# Altium project John Wollam.PrjPCB (part 2 of 2)

## Sheet Connector_Section.SchDoc
size A4; DocumentNumber: 5; SheetNumber: 5; SheetTotal: 5
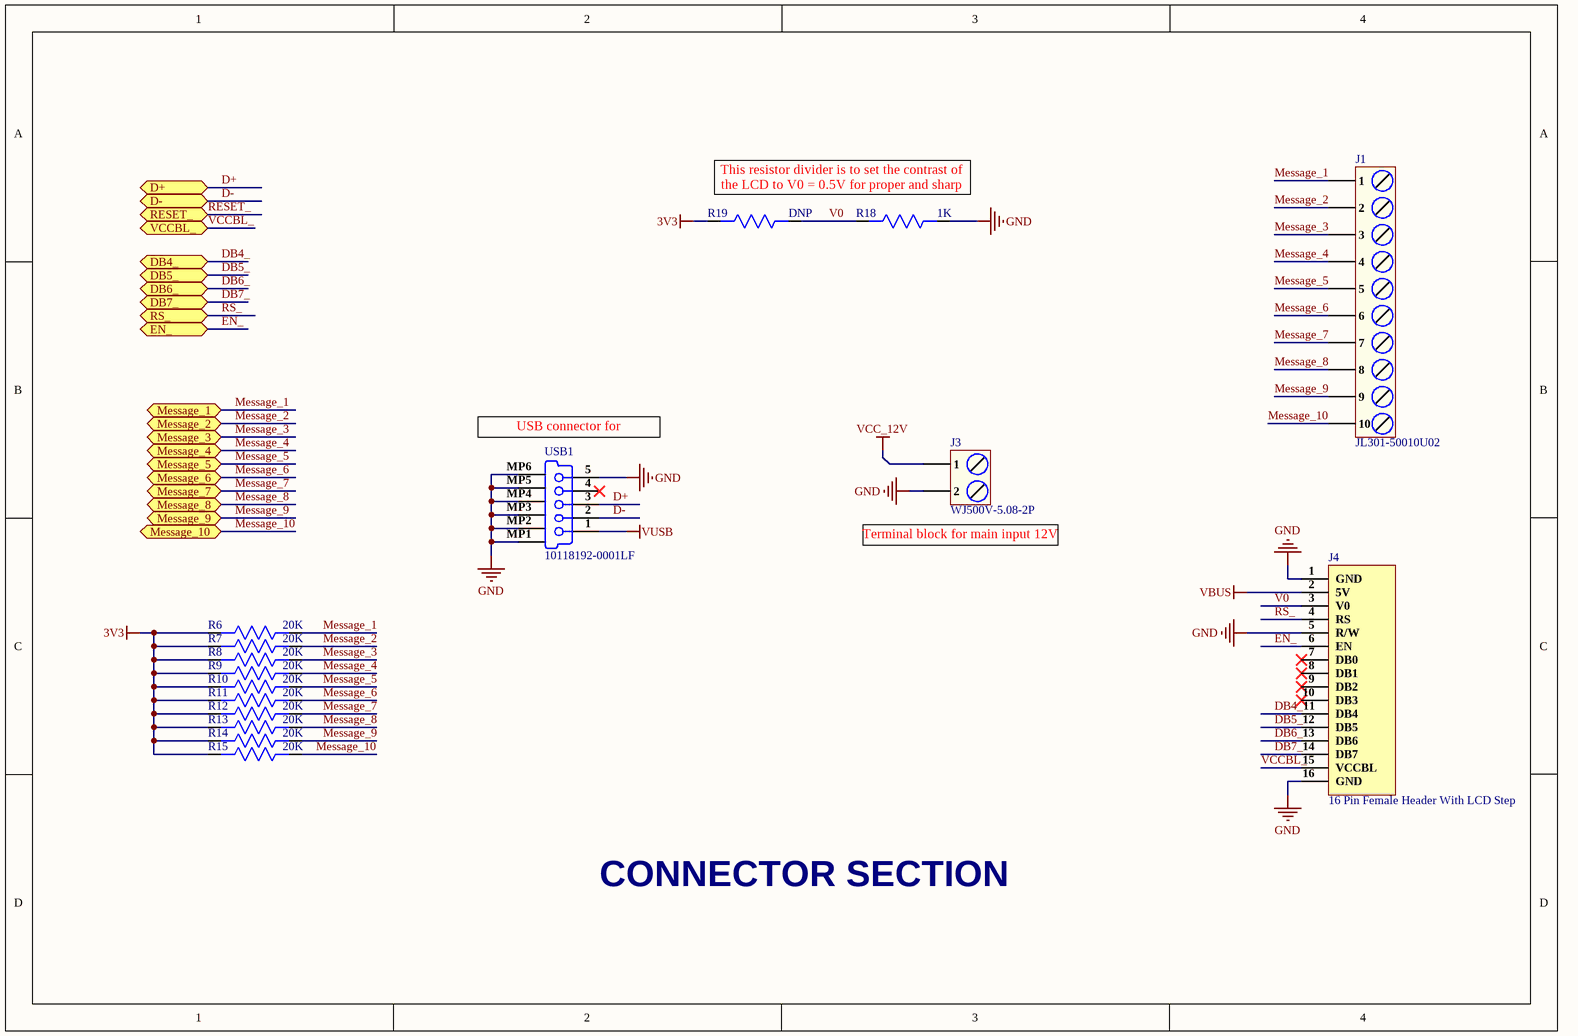
[diagram p3: Connector_Section.SchDoc]

### Parts
J1  JL301-50010U02  [JL301-50010U02]
J3  WJ500V-5.08-2P  [Terminal Block 2P_]
J4  16 Pin Female Header With LCD Step  [PPPC161LFBN-RC_]
R6  20K  [Res-0603]
R7  20K  [Res-0603]
R8  20K  [Res-0603]
R9  20K  [Res-0603]
R10  20K  [Res-0603]
R11  20K  [Res-0603]
R12  20K  [Res-0603]
R13  20K  [Res-0603]
R14  20K  [Res-0603]
R15  20K  [Res-0603]
R18  1K  [Res-0603]
R19  DNP  [Res-0603]
USB1  10118192-0001LF  [10118192-0001LF_]

### Ports
D+ (bidir), D- (bidir), DB4_ (bidir), DB5_ (bidir), DB6_ (bidir), DB7_ (bidir), EN_ (bidir), Message_1 (bidir), Message_2 (bidir), Message_3 (bidir), Message_4 (bidir), Message_5 (bidir), Message_6 (bidir), Message_7 (bidir), Message_8 (bidir), Message_9 (bidir), Message_10 (bidir), RESET_ (bidir), RS_ (bidir), VCCBL_ (bidir)

### Nets
3V3: R6.2 R7.2 R8.2 R9.2 R10.2 R11.2 R12.2 R13.2 R14.2 R15.2 R19.2
GND: J3.2 J4.1(GND) J4.5(R/W) J4.16(GND) R18.1 USB1.5(GND) USB1.MP1 USB1.MP2 USB1.MP3 USB1.MP4 USB1.MP5 USB1.MP6
VBUS: J4.2(5V)
VCC_12V: J3.1
VUSB: USB1.1(V_BUS_(5V))
D+: USB1.3(D+) ; port D+
D-: USB1.2(D-) ; port D-
DB4_: J4.11(DB4) ; port DB4_
DB5_: J4.12(DB5) ; port DB5_
DB6_: J4.13(DB6) ; port DB6_
DB7_: J4.14(DB7) ; port DB7_
EN_: J4.6(EN) ; port EN_
Message_1: J1.1 R6.1 ; port Message_1
Message_2: J1.2 R7.1 ; port Message_2
Message_3: J1.3 R8.1 ; port Message_3
Message_4: J1.4 R9.1 ; port Message_4
Message_5: J1.5 R10.1 ; port Message_5
Message_6: J1.6 R11.1 ; port Message_6
Message_7: J1.7 R12.1 ; port Message_7
Message_8: J1.8 R13.1 ; port Message_8
Message_9: J1.9 R14.1 ; port Message_9
Message_10: J1.10 R15.1 ; port Message_10
RS_: J4.4(RS) ; port RS_
V0: J4.3(V0) R18.2 R19.1
VCCBL_: J4.15(VCCBL) ; port VCCBL_

Not connected (* = marked no-connect by the designer): J4 7(DB0)* 8(DB1)* 9(DB2)* 10(DB3)*; USB1 4(NC)*

### Notes on the sheet
- This resistor divider is to set the contrast of the LCD to V0 = 0.5V for proper and sharp display
- (near USB1) USB connector for programming
- (near J3) Terminal block for main input 12V
- CONNECTOR SECTION

### Library data of the parts
J1 = Terminal Block 10 Position (5MM): 15A 300V Blue Straight pin 5mm 10 Straight,P=5mm Screw terminal; Manufacturer: JILN; Manufacturer Part Number: JL301-50010U02; LCSC Part Number: C409141; ComponentLink1Description: LCSC; ComponentLink1URL: https://www.lcsc.com/product-detail/span-style-background-color-ff0-Screw-span-span-style-background-color-ff0-terminal-span_JILN-JL301-50010U02_C409141.html
J3 = Terminal Block 2POS: 2.5 18A Green Straight pin 5.08mm 1 14~30 2 Straight,P=5.08mm; Manufacturer: Ningbo Kangnex Elec; Manufacturer Part Number: WJ500V-5.08-2P; LCSC Part Number: C8465; ComponentLink1Description: LCSC; ComponentLink1URL: https://www.lcsc.com/product-detail/Screw-span-style-background-color-ff0-terminal-span_Ningbo-Kangnex-Elec-WJ500V-5-08-2P_C8465.html
J4 = PPPC161LFBN-RC: CONN HDR 16POS 0.1 GOLD PCB; Manufacturer: Sullins; Number of Positions: 16; Connector Type: Header,Socket; Pitch: 0.1inch; Supplier 1: Digi-Key; Manufacturer Part Number: PPPC161LFBN-RC; Stock 1: 6865; Pricing 1: 1=1.02, 10=0.897, 100=0.7742, 500=0.63342, 1000=0.56304, 5000=0.5083 (USD); Mount: Through Hole; Color: Black; Contact Plating: Gold; Contact Material: Bronze; Housing Material: Plastic; Package Quantity: 1000; Number of Rows: 1; Packaging: Bulk; Termination: Solder; Length: 41.1mm; Height: 8.5mm; Width: 2.5mm; Lead Free: Lead Free; Supplier Part Number 1: S7049-ND; LCSC Part Number: C3322257; ComponentLink1Description: LCSC; ComponentLink1URL: https://www.lcsc.com/product-detail/Female-Headers_Sullins-Connector-Solutions-PPPC161LFBN-RC_C3322257.html
R6-R15 = RC0603FR-0720KL: RES 20K OHM 1% 1/10W 0603; Manufacturer: Yageo; Resistance: 20kR; Temperature Coefficient: 100ppm/°C; Voltage Rating (DC): 50V; Power Rating: 100mW; Supplier 1: Arrow Electronics; Manufacturer Part Number: RC0603FR-0720KL; RoHS: Yes; Category: Chip SMD Resistors; Stock 1: 945000; Pricing 1: 5000=0.00240, 10000=0.00220, 25000=0.00200, 50000=0.00190, 125000=0.00180 (USD); Case/Package: 0603; Number of Pins: 2; Case Code (Imperial): 0603; Case Code (Metric): 1608; Size Code: 0603; Min Operating Temperature: -55°C; Max Operating Temperature: 155°C; Tolerance: 1%; Packaging: Tape and Reel; Resistor Type: Thick Film; Voltage Rating: 50V; Package Quantity: 1; Termination: SMD/SMT; Number of Terminations: 2; Max Power Dissipation: 100mW; Features: Moisture Resistant; Series: RC; Technology: THICK FILM; Construction: Rectangular; Resistance Tolerance: 1%; Length: 0.063inch; Width: 0.031inch; Height: 0.022inch; Depth: 0.8mm; Lead Free: Lead Free; RoHS Compliant: Yes; REACH SVHC: No SVHC; Military Standard: Not; ComponentLink1URL: https://datasheet.ciiva.com/11808/0900766b80f96399-11808275.pdf?src-supplier=RSComponents; ComponentLink1Description: https://datasheet.ciiva.com/11808/0900766b80f96399-11808275.pdf?src-supplier=RSComponents; ComponentLink2URL: https://datasheet.ciiva.com/22747/443971-22747525.pdf?src-supplier=Element14; ComponentLink2Description: https://datasheet.ciiva.com/22747/443971-22747525.pdf?src-supplier=Element14; ComponentLink3URL: https://datasheet.ciiva.com/2453/pyu-r-int-thick-7-2453911.pdf?src-supplier=Digi-Key; ComponentLink3Description: https://datasheet.ciiva.com/2453/pyu-r-int-thick-7-2453911.pdf?src-supplier=Digi-Key; ComponentLink4URL: https://datasheet.ciiva.com/2453/pyu-r-int-thick-7-2453912.pdf?src-supplier=Digi-Key; ComponentLink4Description: https://datasheet.ciiva.com/2453/pyu-r-int-thick-7-2453912.pdf?src-supplier=Digi-Key; ComponentLink5URL: https://datasheet.ciiva.com/2453/pyu-r-int-thick-7-2453910.pdf?src-supplier=Digi-Key; ComponentLink5Description: https://datasheet.ciiva.com/2453/pyu-r-int-thick-7-2453910.pdf?src-supplier=Digi-Key; Supplier Part Number 1: RC0603FR-0720KL; LCSC Part Number: C105575
R18 = RC0603FR-071KL: RES SMD 1K OHM 1% 1/10W 0603; Manufacturer: Yageo; Resistance: 1kR; Temperature Coefficient: 100ppm/°C; Power Rating: 100mW; Voltage Rating: 50V; ComponentLink1URL: https://www.verical.com/server-webapp/html/getDatasheet?partID=409289&src-supplier=Verical; ComponentLink1Description: https://www.verical.com/server-webapp/html/getDatasheet?partID=409289&src-supplier=Verical; Supplier 1: Digi-Key; Manufacturer Part Number: RC0603FR-071KL; Stock 1: 21472395; Pricing 1: 1=0.1, 10=0.023, 100=0.0094, 1000=0.0042, 2500=0.0037 (USD); Case/Package: 0603; Contact Plating: Tin,Matte; Case Code (Imperial): 0603; Case Code (Metric): 1608; Min Operating Temperature: -55°C; Max Operating Temperature: 155°C; Tolerance: 1%; Composition: Thick Film; Packaging: Tape and Reel; Termination: SMD/SMT; Military Standard: Not; Length: 1.6mm; Height: 0.45mm; Depth: 0.8mm; Radiation Hardening: No; REACH SVHC: No SVHC; Lead Free: Lead Free; ComponentLink2URL: http://documents.rs-components.com/techlib://itc_doclist_GB.htm?stockno=5048928&src-supplier=RSComponents; ComponentLink2Description: http://documents.rs-components.com/techlib://itc_doclist_GB.htm?stockno=5048928&src-supplier=RSComponents; ComponentLink3URL: http://www.yageo.com/documents/recent/PYu-RC0603_51_RoHS_L_4.pdf?src-supplier=Avnet+Europe; ComponentLink3Description: http://www.yageo.com/documents/recent/PYu-RC0603_51_RoHS_L_4.pdf?src-supplier=Avnet+Europe; ComponentLink4URL: http://www.farnell.com/datasheets/2167052.pdf?src-supplier=Element14; ComponentLink4Description: http://www.farnell.com/datasheets/2167052.pdf?src-supplier=Element14; ComponentLink5URL: http://www.farnell.com/datasheets/1868787.pdf?src-supplier=Element14; ComponentLink5Description: http://www.farnell.com/datasheets/1868787.pdf?src-supplier=Element14; ComponentLink6URL: http://www.yageo.com/documents/recent/PYu-RC_Group_51_RoHS_L_2.pdf?src-supplier=Avnet; ComponentLink6Description: http://www.yageo.com/documents/recent/PYu-RC_Group_51_RoHS_L_2.pdf?src-supplier=Avnet; ComponentLink7URL: https://www.verical.com/server-webapp/html/getDatasheet?partID=404327&src-supplier=Verical; ComponentLink7Description: https://www.verical.com/server-webapp/html/getDatasheet?partID=404327&src-supplier=Verical; ComponentLink8URL: http://www.farnell.com/datasheets/443971.pdf?src-supplier=Element14; ComponentLink8Description: http://www.farnell.com/datasheets/443971.pdf?src-supplier=Element14; Supplier Part Number 1: 311-1.00KHRDKR-ND; LCSC Part Number: C22548
R19 = RC0603FR-0756KL: RES 56K OHM 1% 1/10W 0603; Manufacturer: Yageo; Voltage Rating (DC): 50V; Resistance: 56kR; Power Rating: 100mW; Temperature Coefficient: 100ppm/°C; Voltage Rating: 75V; Manufacturer Part Number: RC0603FR-0756KL; Package: 0603; Value: 56K; Supplier 1: RSComponents; RoHS: Yes; Category: Chip SMD Resistors; Stock 1: 15000; Pricing 1: 100=0.01300, 500=0.01200, 1000=0.01100, 2500=0.01000, 5000=0.00900 (GBP); Case/Package: 0603; Number of Pins: 2; Case Code (Metric): 1608; Case Code (Imperial): 0603; Weight: 7.1E-05oz; Size Code: 0603; Min Operating Temperature: -55°C; Max Operating Temperature: 155°C; Tolerance: 1%; Packaging: Tape and Reel; Package Quantity: 1; Resistor Type: Thick Film; Number of Terminations: 2; Termination: SMD/SMT; Max Power Dissipation: 100mW; Features: Moisture Resistant; Series: RC; Resistance Tolerance: 1%; Construction: Rectangular; Length: 1.6mm; Width: 0.8mm; Height: 0.022inch; Depth: 0.8mm; Reach SVHC Compliant: Unknown; Lead Free: Lead Free; Military Standard: Not; RoHS Compliant: Yes; ComponentLink1URL: https://datasheet.ciiva.com/2508/pyu-r-int-thick-7-2508519.pdf?src-supplier=Digi-Key; ComponentLink1Description: https://datasheet.ciiva.com/2508/pyu-r-int-thick-7-2508519.pdf?src-supplier=Digi-Key; ComponentLink2URL: https://datasheet.ciiva.com/2508/pyu-r-int-thick-7-2508520.pdf?src-supplier=Digi-Key; ComponentLink2Description: https://datasheet.ciiva.com/2508/pyu-r-int-thick-7-2508520.pdf?src-supplier=Digi-Key; ComponentLink3URL: https://datasheet.ciiva.com/2508/pyu-r-int-thick-7-2508518.pdf?src-supplier=Digi-Key; ComponentLink3Description: https://datasheet.ciiva.com/2508/pyu-r-int-thick-7-2508518.pdf?src-supplier=Digi-Key; ComponentLink4URL: https://datasheet.ciiva.com/7746/443971-7746377.pdf?src-supplier=Element14; ComponentLink4Description: https://datasheet.ciiva.com/7746/443971-7746377.pdf?src-supplier=Element14; ComponentLink5URL: https://datasheet.ciiva.com/7746/443971-7746376.pdf?src-supplier=Element14; ComponentLink5Description: https://datasheet.ciiva.com/7746/443971-7746376.pdf?src-supplier=Element14; ComponentLink6URL: https://datasheet.ciiva.com/15189/getdatasheetpartid-329310-15189781.pdf?src-supplier=Verical; ComponentLink6Description: https://datasheet.ciiva.com/15189/getdatasheetpartid-329310-15189781.pdf?src-supplier=Verical; Supplier Part Number 1: 1995607; LCSC Part Number: C114630
USB1 = 10118192-0001LF: CONN RCPT USB2.0 MICRO B SMD R/A; Manufacturer: Amphenol FCI; Gender: Receptacle; Current Rating: 1.8A; Connector Type: USB,Receptacle; Number of Contacts: 5; Number of Ports: 1; Insulation Resistance: 1GR; Max Voltage Rating (AC): 100V; Pitch: 0.65mm; Supplier 1: Digi-Key; Manufacturer Part Number: 10118192-0001LF; Stock 1: 32977; Pricing 1: 1=0.43, 10=0.405, 25=0.3648, 50=0.3242, 100=0.3107, 250=0.28368, 500=0.27016 (USD); Mount: Surface Mount,Horizontal; Contact Plating: Gold; Contact Material: Copper Alloy; Color: Black; Number of Terminals: 5; Housing Material: Polymer; Min Operating Temperature: -55°C; Max Operating Temperature: 85°C; Termination: Solder; Packaging: Tape and Reel; Orientation: Right Angle; Package Quantity: 1400; Features: Shielded; Voltage Rating: 100V; USB Standard: USB 2.0; Length: 7.86mm; Depth: 5.57mm; Radiation Hardening: No; Flammability Rating: UL94 V-0; Lead Free: Lead Free; REACH SVHC: No SVHC; ComponentLink1URL: https://cdn.amphenol-icc.com/media/wysiwyg/files/documentation/datasheet/inputoutput/io_usb_micro.pdf?src-supplier=Verical; ComponentLink1Description: https://cdn.amphenol-icc.com/media/wysiwyg/files/documentation/datasheet/inputoutput/io_usb_micro.pdf?src-supplier=Verical; ComponentLink2URL: http://www.amphenol-icc.com/media/wysiwyg/files/drawing/10118192.pdf?src-supplier=Digi-Key; ComponentLink2Description: http://www.amphenol-icc.com/media/wysiwyg/files/drawing/10118192.pdf?src-supplier=Digi-Key; ComponentLink3URL: https://cdn.amphenol-icc.com/media/wysiwyg/files/documentation/datasheet/inputoutput/io_usb_micro.pdf?src-supplier=Mouser; ComponentLink3Description: https://cdn.amphenol-icc.com/media/wysiwyg/files/documentation/datasheet/inputoutput/io_usb_micro.pdf?src-supplier=Mouser; Supplier Part Number 1: 609-4613-6-ND; LCSC Part Number: C132564

## Sheet Logiclevel_Converter_Section.SchDoc
size A; DocumentNumber: 4; SheetNumber: 4; SheetTotal: 5
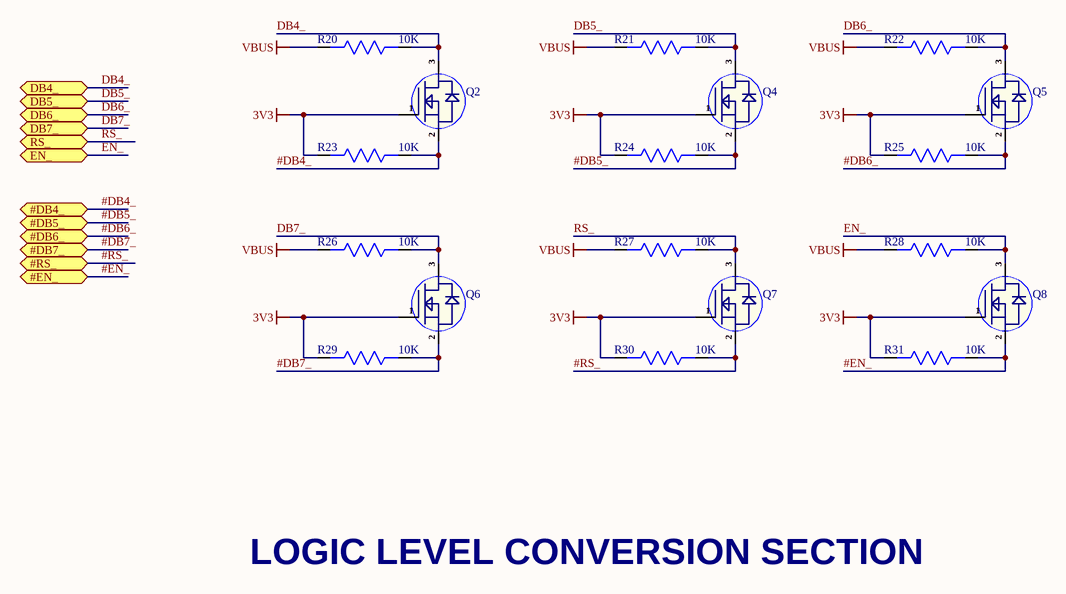
[diagram p4: Logiclevel_Converter_Section.SchDoc]

### Parts
Q2  BSS138LT1G  [SOT-23]  (value not drawn)
Q4  BSS138LT1G  [SOT-23]  (value not drawn)
Q5  BSS138LT1G  [SOT-23]  (value not drawn)
Q6  BSS138LT1G  [SOT-23]  (value not drawn)
Q7  BSS138LT1G  [SOT-23]  (value not drawn)
Q8  BSS138LT1G  [SOT-23]  (value not drawn)
R20  10K  [Res-0603]
R21  10K  [Res-0603]
R22  10K  [Res-0603]
R23  10K  [Res-0603]
R24  10K  [Res-0603]
R25  10K  [Res-0603]
R26  10K  [Res-0603]
R27  10K  [Res-0603]
R28  10K  [Res-0603]
R29  10K  [Res-0603]
R30  10K  [Res-0603]
R31  10K  [Res-0603]

### Ports
#DB4_ (bidir), #DB5_ (bidir), #DB6_ (bidir), #DB7_ (bidir), #EN_ (bidir), #RS_ (bidir), DB4_ (bidir), DB5_ (bidir), DB6_ (bidir), DB7_ (bidir), EN_ (bidir), RS_ (bidir)

### Nets
3V3: Q2.1(G) Q4.1(G) Q5.1(G) Q6.1(G) Q7.1(G) Q8.1(G) R23.2 R24.2 R25.2 R29.2 R30.2 R31.2
VBUS: R20.2 R21.2 R22.2 R26.2 R27.2 R28.2
#DB4_: Q2.2(S) R23.1 ; port #DB4_
#DB5_: Q4.2(S) R24.1 ; port #DB5_
#DB6_: Q5.2(S) R25.1 ; port #DB6_
#DB7_: Q6.2(S) R29.1 ; port #DB7_
#EN_: Q8.2(S) R31.1 ; port #EN_
#RS_: Q7.2(S) R30.1 ; port #RS_
DB4_: Q2.3(D) R20.1 ; port DB4_
DB5_: Q4.3(D) R21.1 ; port DB5_
DB6_: Q5.3(D) R22.1 ; port DB6_
DB7_: Q6.3(D) R26.1 ; port DB7_
EN_: Q8.3(D) R28.1 ; port EN_
RS_: Q7.3(D) R27.1 ; port RS_

### Notes on the sheet
- LOGIC LEVEL CONVERSION SECTION

### Library data of the parts
Q2 Q4-Q8 = BSS138LT1G: MOSFET N-CH 50V 200MA SOT-23; Manufacturer: ON Semiconductor; Gate to Source Voltage (Vgs): 20V; Nominal Vgs: 1.5V; Rds On Max: 3.5R; Input Capacitance: 50pF; Number of Elements: 1; Max Power Dissipation: 225mW; Turn-Off Delay Time: 20ns; Element Configuration: Single; ComponentLink1URL: https://datasheet.ciiva.com/22641/1596366-22641636.pdf; ComponentLink1Description: https://datasheet.ciiva.com/22641/1596366-22641636.pdf; ComponentLink2URL: https://datasheet.ciiva.com/1190/1596366-1190137.pdf; ComponentLink2Description: https://datasheet.ciiva.com/1190/1596366-1190137.pdf; ComponentLink3URL: https://datasheet.ciiva.com/15198/getdatasheetpartid-110266-15198908.pdf; ComponentLink3Description: https://datasheet.ciiva.com/15198/getdatasheetpartid-110266-15198908.pdf; ComponentLink4URL: https://datasheet.ciiva.com/8115/bss138lt1-d-8115295.pdf; ComponentLink4Description: https://datasheet.ciiva.com/8115/bss138lt1-d-8115295.pdf; ComponentLink5URL: https://datasheet.ciiva.com/8115/bss138lt1-d-8115358.pdf; ComponentLink5Description: https://datasheet.ciiva.com/8115/bss138lt1-d-8115358.pdf; ComponentLink6URL: https://datasheet.ciiva.com/1190/1596366-1190136.pdf; ComponentLink6Description: https://datasheet.ciiva.com/1190/1596366-1190136.pdf; ComponentLink7URL: https://datasheet.ciiva.com/936/bss138lt1-d-936802.pdf; ComponentLink7Description: https://datasheet.ciiva.com/936/bss138lt1-d-936802.pdf; ComponentLink8URL: https://datasheet.ciiva.com/936/bss138lt1-d-936801.pdf; ComponentLink8Description: https://datasheet.ciiva.com/936/bss138lt1-d-936801.pdf; ComponentLink9URL: https://datasheet.ciiva.com/14553/70099493-14553829.pdf; ComponentLink9Description: https://datasheet.ciiva.com/14553/70099493-14553829.pdf; ComponentLink10URL: https://datasheet.ciiva.com/936/bss138lt1-d-936803.pdf; ComponentLink10Description: https://datasheet.ciiva.com/936/bss138lt1-d-936803.pdf; Supplier 1: Digi-Key; Manufacturer Part Number: BSS138LT1G; Stock 1: 1283212; Pricing 1: 1=0.27, 10=0.222, 100=0.1177, 500=0.07746, 1000=0.05267 (USD); Case/Package: SOT-23-3; Number of Pins: 3; Contact Plating: Tin,Matte; Min Operating Temperature: -55°C; Max Operating Temperature: 150°C; Continuous Drain Current (ID): 200mA; Package Quantity: 1; Packaging: Tape and Reel; Drain to Source Breakdown Voltage: 50V; Power Dissipation: 225mW; Drain to Source Resistance: 3.5R; Threshold Voltage: 1.5V; Turn-On Delay Time: 20ns; Voltage Rating (DC): 50V; Current Rating: 200mA; On-State Resistance: 3.5R; Length: 3.04mm; Height: 1.01mm; Width: 1.4mm; Radiation Hardening: No; REACH SVHC: No SVHC; Lead Free: Lead Free; Halogen Free: Halogen Free; ComponentLink11URL: http://www.onsemi.com/pub/Collateral/BSS138LT1-D.PDF?src-supplier=Digi-Key; ComponentLink11Description: http://www.onsemi.com/pub/Collateral/BSS138LT1-D.PDF?src-supplier=Digi-Key; ComponentLink12URL: http://www.farnell.com/datasheets/1596366.pdf?src-supplier=Element14; ComponentLink12Description: http://www.farnell.com/datasheets/1596366.pdf?src-supplier=Element14; ComponentLink13URL: http://www.alliedelec.com/m/d/b3c6fd7d92596813fe75d33dcbaaae90.pdf?src-supplier=Allied+Electronics; ComponentLink13Description: http://www.alliedelec.com/m/d/b3c6fd7d92596813fe75d33dcbaaae90.pdf?src-supplier=Allied+Electronics; ComponentLink14URL: https://www.verical.com/server-webapp/html/getDatasheet?partID=110266&src-supplier=Verical; ComponentLink14Description: https://www.verical.com/server-webapp/html/getDatasheet?partID=110266&src-supplier=Verical; ComponentLink15URL: http://www.onsemi.com/pub_link/Collateral/BSS138LT1-D.PDF?src-supplier=Avnet; ComponentLink15Description: http://www.onsemi.com/pub_link/Collateral/BSS138LT1-D.PDF?src-supplier=Avnet; Supplier Part Number 1: BSS138LT1GOSDKR-ND; LCSC Part Number: C82045
R20-R31 = RC0603FR-0710KL: RES SMD 10K Ohm 1% 1/10W 0603; Manufacturer: Yageo; Resistance: 10kR; Temperature Coefficient: 100ppm/°C; Voltage Rating (DC): 50V; Power Rating: 100mW; Voltage Rating: 75V; Supplier 1: Digi-Key; Manufacturer Part Number: RC0603FR-0710KL; RoHS: Yes; Category: Chip SMD Resistors; Stock 1: 25249139; Pricing 1: 1=0.10000, 10=0.02400, 100=0.00970, 1000=0.00436, 2500=0.00378 (USD); Case/Package: 0603; Number of Pins: 2; Case Code (Imperial): 0603; Case Code (Metric): 1608; Weight: 7.1E-05oz; Size Code: 0603; Min Operating Temperature: -55°C; Max Operating Temperature: 155°C; Tolerance: 1%; Resistor Type: Thick Film; Packaging: Tape and Reel; Termination: SMD/SMT; Features: Moisture Resistant; Series: RC; Max Power Dissipation: 100mW; Number of Terminations: 2; Resistance Tolerance: 1%; Construction: Rectangular; Length: 1.6mm; Width: 0.8mm; Height: 0.45mm; Depth: 0.8mm; Lead Pitch: 0.3mm; REACH SVHC: Unknown; Lead Free: Lead Free; Military Standard: Not; RoHS Compliant: Yes; ComponentLink1URL: https://datasheet.ciiva.com/7660/38590-7660789.pdf?src-supplier=Element14; ComponentLink1Description: https://datasheet.ciiva.com/7660/38590-7660789.pdf?src-supplier=Element14; ComponentLink2URL: https://datasheet.ciiva.com/7983/443971-7983596.pdf?src-supplier=Element14; ComponentLink2Description: https://datasheet.ciiva.com/7983/443971-7983596.pdf?src-supplier=Element14; ComponentLink3URL: https://datasheet.ciiva.com/22747/443971-22747519.pdf?src-supplier=Element14; ComponentLink3Description: https://datasheet.ciiva.com/22747/443971-22747519.pdf?src-supplier=Element14; ComponentLink4URL: https://datasheet.ciiva.com/46440/1868787-46440891.pdf?src-supplier=Element14; ComponentLink4Description: https://datasheet.ciiva.com/46440/1868787-46440891.pdf?src-supplier=Element14; ComponentLink5URL: https://datasheet.ciiva.com/7746/1738695-7746239.pdf?src-supplier=Element14; ComponentLink5Description: https://datasheet.ciiva.com/7746/1738695-7746239.pdf?src-supplier=Element14; ComponentLink6URL: https://datasheet.ciiva.com/15189/getdatasheetpartid-409289-15189591.pdf?src-supplier=Verical; ComponentLink6Description: https://datasheet.ciiva.com/15189/getdatasheetpartid-409289-15189591.pdf?src-supplier=Verical; Supplier Part Number 1: 311-10.0KHRCT-ND; LCSC Part Number: C98220

## Nets that join several sheets
3V3: Controller_Section (13 pins), Power_Section (C11.1 U2.2 U2.4), Connector_Section (11 pins), Logiclevel_Converter_Section (12 pins)
GND: Controller_Section (17 pins), Power_Section (10 pins), Connector_Section (12 pins)
VBUS: Power_Section (6 pins), Connector_Section (J4.2), Logiclevel_Converter_Section (6 pins)
VCC: Controller_Section (R1.2), Power_Section (5 pins)
VCC_12V: Power_Section (C16.1 R32.2 U3.6), Connector_Section (J3.1)
VUSB: Power_Section (D2.2), Connector_Section (USB1.1)
#DB4_: Controller_Section (U1.28), Logiclevel_Converter_Section (Q2.2 R23.1)
#DB5_: Controller_Section (U1.29), Logiclevel_Converter_Section (Q4.2 R24.1)
#DB6_: Controller_Section (U1.30), Logiclevel_Converter_Section (Q5.2 R25.1)
#DB7_: Controller_Section (U1.31), Logiclevel_Converter_Section (Q6.2 R29.1)
#EN_: Controller_Section (U1.38), Logiclevel_Converter_Section (Q8.2 R31.1)
#RS_: Controller_Section (U1.39), Logiclevel_Converter_Section (Q7.2 R30.1)
D+: Controller_Section (U1.33), Connector_Section (USB1.3)
D-: Controller_Section (U1.32), Connector_Section (USB1.2)
DB4_: Connector_Section (J4.11), Logiclevel_Converter_Section (Q2.3 R20.1)
DB5_: Connector_Section (J4.12), Logiclevel_Converter_Section (Q4.3 R21.1)
DB6_: Connector_Section (J4.13), Logiclevel_Converter_Section (Q5.3 R22.1)
DB7_: Connector_Section (J4.14), Logiclevel_Converter_Section (Q6.3 R26.1)
EN_: Connector_Section (J4.6), Logiclevel_Converter_Section (Q8.3 R28.1)
Message_1: Controller_Section (U1.10), Connector_Section (J1.1 R6.1)
Message_2: Controller_Section (U1.11), Connector_Section (J1.2 R7.1)
Message_3: Controller_Section (U1.12), Connector_Section (J1.3 R8.1)
Message_4: Controller_Section (U1.13), Connector_Section (J1.4 R9.1)
Message_5: Controller_Section (U1.14), Connector_Section (J1.5 R10.1)
Message_6: Controller_Section (U1.15), Connector_Section (J1.6 R11.1)
Message_7: Controller_Section (U1.16), Connector_Section (J1.7 R12.1)
Message_8: Controller_Section (U1.17), Connector_Section (J1.8 R13.1)
Message_9: Controller_Section (U1.18), Connector_Section (J1.9 R14.1)
Message_10: Controller_Section (U1.19), Connector_Section (J1.10 R15.1)
RS_: Connector_Section (J4.4), Logiclevel_Converter_Section (Q7.3 R27.1)
VCCBL_: Power_Section (R4.1 SB1.2), Connector_Section (J4.15)